# Altium schematic sheet Ringer_Sheet.SchDoc
size A4; SheetNumber: 3; SheetTotal: 6
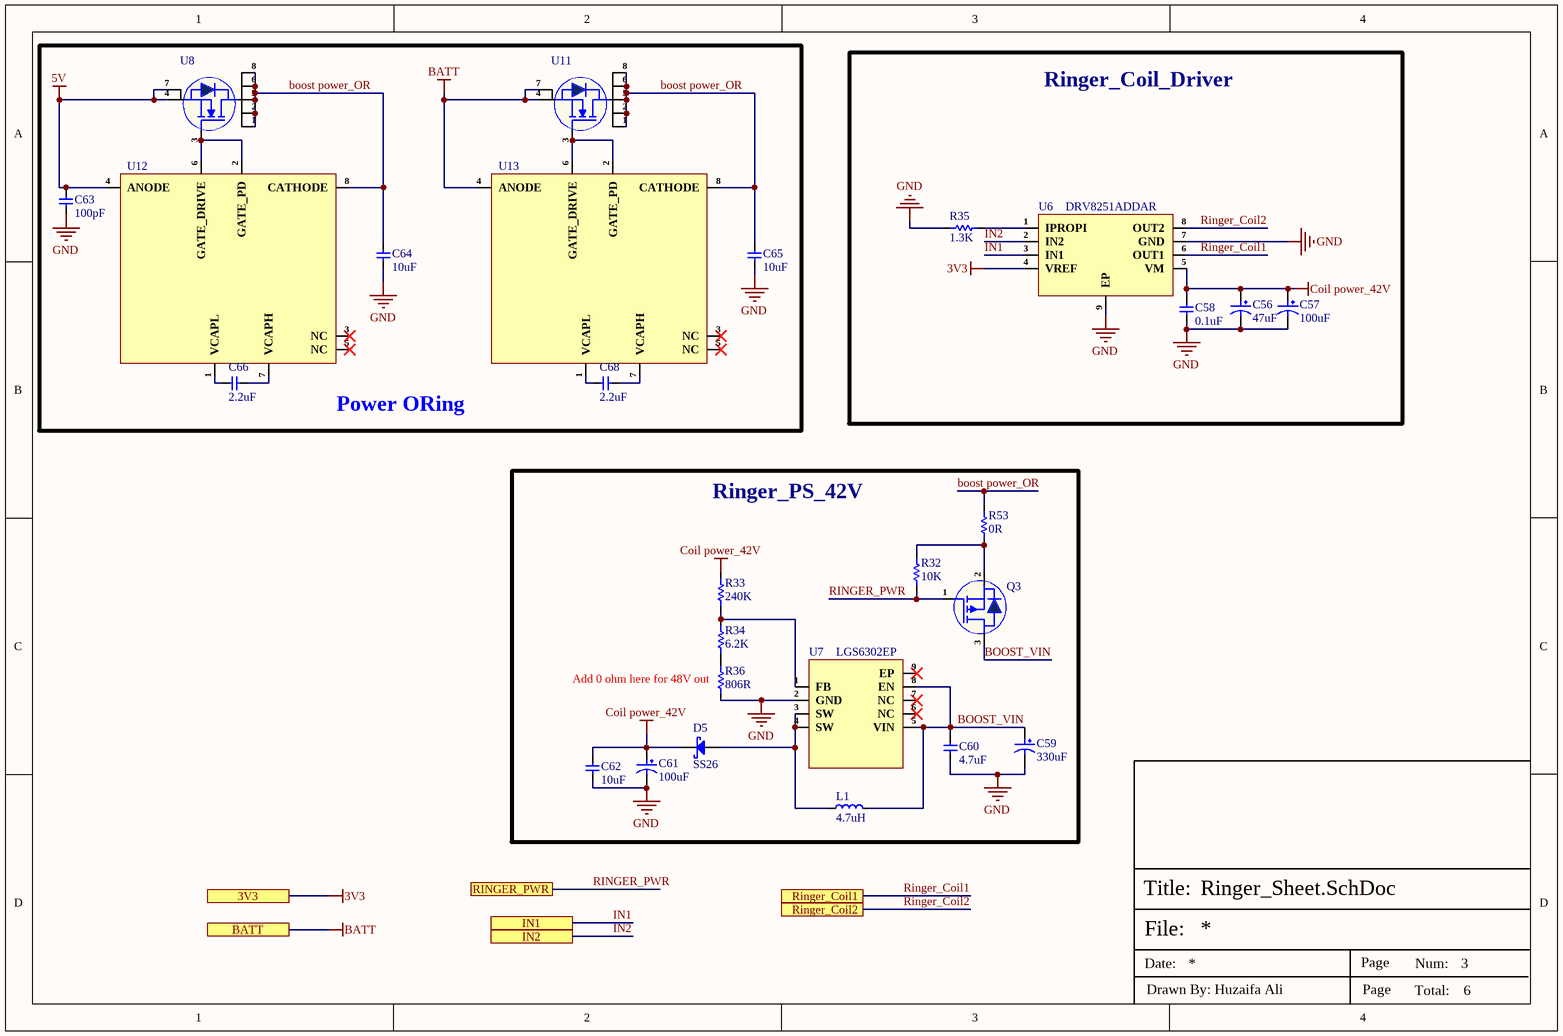
[diagram p0: Ringer_Sheet.SchDoc]

## Parts
C56  47uF  [EEEFN1K470UP]
C57  100uF  [VKMD1451K101MV]
C58  0.1uF  [Cap-0603]
C59  330uF  [GVT1C331M0607]
C60  4.7uF  [Cap-0402]
C61  100uF  [VKMD1451K101MV]
C62  10uF  [Cap-1210]
C63  100pF  [Cap-0805]
C64  10uF  [Cap-1210]
C65  10uF  [Cap-1210]
C66  2.2uF  [Cap-0805]
C68  2.2uF  [Cap-0805]
D5  SS26  [SMA(DO-214AC)]
L1  4.7uH  [YPRH0704-4R7M]
Q3  SSM3J328R,LF  [SOT-23F]  (value not drawn)
R32  10K  [Res-0402]
R33  240K  [Res-0402]
R34  6.2K  [Res-0402]
R35  1.3K  [Res-0402]
R36  806R  [Res-0402]
R53  0R  [Res-0603]
U6  DRV8251ADDAR  [SOPowerPAD(DDA)-8]
U7  LGS6302EP  [ESOP-8]
U8  CSD17313Q2  [CSD17313Q2]  (value not drawn)
U11  CSD17313Q2  [CSD17313Q2]  (value not drawn)
U12  LM74610QDGKRQ1  [8-VSSOP (5x3.1mm)]  (value not drawn)
U13  LM74610QDGKRQ1  [8-VSSOP (5x3.1mm)]  (value not drawn)

## Blocks framed on the sheet
Ringer_Coil_Driver: C56-C58 R35 U6
Ringer_PS_42V: C59-C62 D5 L1 Q3 R32-R34 R36 R53 U7

## Ports
3V3, BATT, IN1, IN2, Ringer_Coil1, Ringer_Coil2, RINGER_PWR

## Nets
3V3: U6.4(VREF) ; port 3V3
5V: C63.2 U8.4(S) U8.7(S) U12.4(ANODE)
BATT: U11.4(S) U11.7(S) U13.4(ANODE) ; port BATT
Coil power_42V: C56.1 C57.1 C58.2 C61.1 C62.2 D5.1(K) R33.2 U6.5(VM)
GND: C56.2 C57.2 C58.1 C59.2 C60.1 C61.2 C62.1 C63.1 C64.1 C65.1 R35.1 R36.1 U6.7(GND) U6.9(EP) U7.2(GND)
boost power_OR: C64.2 C65.2 R53.2 U8.1(D) U8.2(D) U8.5(D) U8.6(D) U8.8(D) U11.1(D) U11.2(D) U11.5(D) U11.6(D) U11.8(D) U12.8(CATHODE) U13.8(CATHODE)
BOOST_VIN: C59.1 C60.2 L1.2 Q3.3(D) U7.5(VIN) U7.8(EN)
IN1: U6.3(IN1) ; port IN1
IN2: U6.2(IN2) ; port IN2
Ringer_Coil1: U6.6(OUT1) ; port Ringer_Coil1
Ringer_Coil2: U6.8(OUT2) ; port Ringer_Coil2
RINGER_PWR: Q3.1(G) R32.1 ; port RINGER_PWR
NetC66_1: C66.1 U12.1(VCAPL)
NetC66_2: C66.2 U12.7(VCAPH)
NetC68_1: C68.1 U13.1(VCAPL)
NetC68_2: C68.2 U13.7(VCAPH)
NetD5_2: D5.2(A) L1.1 U7.3(SW) U7.4(SW)
NetQ3_2: Q3.2(S) R32.2 R53.1
NetR33_1: R33.1 R34.2 U7.1(FB)
NetR34_1: R34.1 R36.2
NetR35_2: R35.2 U6.1(IPROPI)
NetU8_3: U8.3(G) U12.2(GATE_PD) U12.6(GATE_DRIVE)
NetU11_3: U11.3(G) U13.2(GATE_PD) U13.6(GATE_DRIVE)

Not connected (* = marked no-connect by the designer): U7 6(NC)* 7(NC)* 9(EP)*; U12 3(NC)* 5(NC)*; U13 3(NC)* 5(NC)*

## Notes on the sheet
- Power ORing
- (near R36) Add 0 ohm here for 48V out
- File:
- Title:
- Date:
- Page
- Num:
- Total:
- Drawn By: Huzaifa Ali

## Library data of the parts
C56 = EEE-FN1K470UP: CAP ALUM 47UF 20% 80V SMD; Manufacturer: Panasonic; Item Type: Capacitors; Dissipation Factor: 8%; ESR (Equivalent Series Resistance): 1.3R; Leakage Current: 37.6uA; Life (Hours): 2000Hour; Ripple Current: 130mA; Supplier: Mouser; LCSC Part Number: C494871; Manufacturer Part Number: EEE-FN1K470UP; RoHS: No; Stock: 4971; Pricing: 1=0.81, 10=0.516, 50=0.516, 100=0.413, 1000=0.296, 10000=0.249 (USD); Case/Package: Radial; Min Operating Temperature: -55°C; Max Operating Temperature: 105°C; Value: 47uF; Tolerance: 20%; Voltage Rating: 80V; Height: 10.5mm
C57 C61 = VKMD1451K101MV: 100uF 80V 735mA@100kHz ±20% SMD,D8xL14.5mm Aluminum Electrolytic Capacitors - SMD ROHS; Manufacturer: Ymin; Manufacturer Part Number: VKMD1451K101MV; Package: SMD,D8xL14.5mm; LCSC Part Number: C487409; Item Type: Capacitor; ComponentLink1Description: LCSC; ComponentLink1URL: https://www.lcsc.com/product-detail/Aluminum-Electrolytic-Capacitors-SMD_Ymin-VKMD1451K101MV_C487409.html
C58 = CC0603ZRY5V9BB104: CAP CER 0.1UF 50V Y5V 0603; Manufacturer: Yageo; Capacitance: 100nF; Tolerance: 80%; Item Type: Capacitor; Supplier 1: Digi-Key; Manufacturer Part Number: CC0603ZRY5V9BB104; Stock 1: 15000880; Pricing 1: 1=0.1, 10=0.075, 100=0.0334, 500=0.02386, 1000=0.01874 (USD); Mount: Surface Mount; Case/Package: 0603; Number of Pins: 2; Case Code (Metric): 1608; Case Code (Imperial): 0603; Min Operating Temperature: -30°C; Max Operating Temperature: 85°C; Dielectric: Y5V; Voltage Rating: 50V; Package Quantity: 1; Packaging: Tape and Reel; Voltage Rating (DC): 50V; Termination: SMD/SMT; Composition: Ceramic; Voltage: 50V; Length: 1.6mm; Height: 0.8mm; Width: 0.031inch; Thickness: 0.035inch; Depth: 0.8mm; Radiation Hardening: No; REACH SVHC: No SVHC; Lead Free: Lead Free; Halogen Free: Halogen Free; ComponentLink1URL: http://www.yageo.com/documents/recent/UPY-GPHC_Y5V_6.3V-to-50V_8.pdf?src-supplier=Digi-Key; ComponentLink1Description: http://www.yageo.com/documents/recent/UPY-GPHC_Y5V_6.3V-to-50V_8.pdf?src-supplier=Digi-Key; ComponentLink2URL: http://www.yageo.com/documents/recent/UPY-GPHC_Y5V_6.3V-to-50V_5.pdf?src-supplier=Avnet+Europe; ComponentLink2Description: http://www.yageo.com/documents/recent/UPY-GPHC_Y5V_6.3V-to-50V_5.pdf?src-supplier=Avnet+Europe; ComponentLink3URL: https://www.verical.com/server-webapp/html/getDatasheet?partID=403611&src-supplier=Verical; ComponentLink3Description: https://www.verical.com/server-webapp/html/getDatasheet?partID=403611&src-supplier=Verical; ComponentLink4URL: http://www.mouser.com/ds/2/447/Yageo_UPY-GP_NP0_16V-to-50V_9-358835.pdf?src-supplier=Mouser; ComponentLink4Description: http://www.mouser.com/ds/2/447/Yageo_UPY-GP_NP0_16V-to-50V_9-358835.pdf?src-supplier=Mouser; ComponentLink5URL: http://www.farnell.com/datasheets/1132289.pdf?src-supplier=Element14; ComponentLink5Description: http://www.farnell.com/datasheets/1132289.pdf?src-supplier=Element14; Supplier Part Number 1: 311-1343-1-ND; LCSC Part Number: C106221
C59 = GVT1C331M0607: 330uF 16V ±20% SMD,D6.3xL7.7mm Aluminum Electrolytic Capacitors - SMD ROHS; Manufacturer: Honor Elec; Manufacturer Part Number: GVT1C331M0607; Package: SMD,D6.3xL7.7mm; LCSC Part Number: C2980164; Item Type: Capacitor; ComponentLink1Description: LCSC; ComponentLink1URL: https://www.lcsc.com/product-detail/Aluminum-Electrolytic-Capacitors-SMD_Honor-Elec-GVT1C331M0607_C2980164.html
C60 = CC0402KRX5R6BB475: CAP CER 4.7UF 10V X5R 0402; Manufacturer: Yageo; Tolerance: 10%; Supplier 1: Farnell; Manufacturer Part Number: CC0402KRX5R6BB475; RoHS: Yes; Category: Ceramic Capacitors; Stock 1: 20000; Pricing 1: 10000=0.02310, 50000=0.02100 (GBP); Mount: Surface Mount; Case/Package: 0402; Case Code (Imperial): 0402; Case Code (Metric): 1005; Min Operating Temperature: -55°C; Max Operating Temperature: 85°C; Packaging: Cut Tape; Capacitance: 4.7uF; Voltage Rating: 10V; RoHS Compliant: Yes; ComponentLink1URL: http://www.yageo.com/documents/recent/UPY-GPHC_X5R_4V-to-50V_25.pdf?src-supplier=Digi-Key; ComponentLink1Description: http://www.yageo.com/documents/recent/UPY-GPHC_X5R_4V-to-50V_25.pdf?src-supplier=Digi-Key; Supplier Part Number 1: 3871698; LCSC Part Number: C326586
C62 C64 C65 = GRM32ER71J106KA12L: CAP CER 10UF 63V X7R 1210; Manufacturer: Murata; Item Type: Capacitor; Supplier: Avnet; Supplier Part Number: GRM32ER71J106KA12L; Manufacturer Part Number: GRM32ER71J106KA12L; RoHS: Yes; Stock: 55000; Pricing: 1000=0.3451, 2000=0.33698, 4000=0.32886, 6000=0.32074, 8000=0.31262 (USD); ComponentLink1URL: http://www.mouser.com/ds/2/281/c02e-2905.pdf?src-supplier=Mouser; ComponentLink1Description: http://www.mouser.com/ds/2/281/c02e-2905.pdf?src-supplier=Mouser; ComponentLink2URL: http://www.farnell.com/datasheets/2079202.pdf?src-supplier=Farnell; ComponentLink2Description: http://www.farnell.com/datasheets/2079202.pdf?src-supplier=Farnell; ComponentLink3URL: http://search.murata.co.jp/Ceramy/image/img/A01X/G101/ENG/GRM32ER71J106KA12-01.pdf?src-supplier=Digi-Key; ComponentLink3Description: http://search.murata.co.jp/Ceramy/image/img/A01X/G101/ENG/GRM32ER71J106KA12-01.pdf?src-supplier=Digi-Key; ComponentLink4URL: https://datasheet.octopart.com/GRM32ER71J106KA12L-Murata-datasheet-22122223.pdf?src-supplier=Future+Electronics; ComponentLink4Description: https://datasheet.octopart.com/GRM32ER71J106KA12L-Murata-datasheet-22122223.pdf?src-supplier=Future+Electronics; ComponentLink5URL: http://psearch.en.murata.com/capacitor/product/GRM32ER71J106KA12%23.pdf?src-supplier=Avnet; ComponentLink5Description: http://psearch.en.murata.com/capacitor/product/GRM32ER71J106KA12%23.pdf?src-supplier=Avnet; ComponentLink6URL: http://www.farnell.com/datasheets/2079202.pdf?src-supplier=Newark; ComponentLink6Description: http://www.farnell.com/datasheets/2079202.pdf?src-supplier=Newark; ComponentLink7URL: http://www.farnell.com/datasheets/2079202.pdf?src-supplier=Element14; ComponentLink7Description: http://www.farnell.com/datasheets/2079202.pdf?src-supplier=Element14; Package: 1210; LCSC Part Number: C437568; ComponentLink8Description: LCSC; ComponentLink8URL: https://www.lcsc.com/product-detail/Multilayer-Ceramic-Capacitors-MLCC-SMD-SMT_Murata-Electronics-GRM32ER71J106KA12L_C437568.html
C63 = CC0805KRX7R9BB101: CAP CER 100PF 50V X7R 0805; Manufacturer: Yageo; Item Type: Capacitor; Supplier: Future Electronics; Supplier Part Number: 3327608; Manufacturer Part Number: CC0805KRX7R9BB101; RoHS: Yes; Category: Ceramic Capacitors; Stock: 516000; Pricing: 4000=0.0077, 16000=0.0073, 60000=0.007, 100000=0.0068, 200000=0.0065 (USD); ComponentLink1URL: https://datasheet.ciiva.com/11465/upy-gphc-x7r-6-3v-to-50v-8-11465306.pdf?src-supplier=Avnet; ComponentLink1Description: https://datasheet.ciiva.com/11465/upy-gphc-x7r-6-3v-to-50v-8-11465306.pdf?src-supplier=Avnet; LCSC Part Number: C107140
C66 C68 = C2012X5R1H225K125AB: CAP CER 2.2UF 50V X5R 0805; Manufacturer: TDK; Dielectric Material: 4241ConductorMaterial; Item Type: Capacitor; Supplier: Avnet; Supplier Part Number: C2012X5R1H225K125AB; Manufacturer Part Number: C2012X5R1H225K125AB; RoHS: Yes; Category: Ceramic Capacitors; Stock: 6000; Pricing: 2000=0.08532 (USD); Material: 4241ConductorMaterial; Lead Free: 5697LeadFree; ComponentLink1URL: https://datasheet.ciiva.com/24216/c2012x5r1h225k125ab-264892-24216756.pdf?src-supplier=Mouser; ComponentLink1Description: https://datasheet.ciiva.com/24216/c2012x5r1h225k125ab-264892-24216756.pdf?src-supplier=Mouser; ComponentLink2URL: https://datasheet.ciiva.com/6287/tdkmlcccaprange-6287487.pdf?src-supplier=Digikey; ComponentLink2Description: https://datasheet.ciiva.com/6287/tdkmlcccaprange-6287487.pdf?src-supplier=Digikey; ComponentLink3URL: https://datasheet.ciiva.com/6287/tdkmlcccaprange-6287494.pdf?src-supplier=Digikey; ComponentLink3Description: https://datasheet.ciiva.com/6287/tdkmlcccaprange-6287494.pdf?src-supplier=Digikey; ComponentLink4URL: https://datasheet.ciiva.com/6287/tdkmlcccaprange-6287500.pdf?src-supplier=Digikey; ComponentLink4Description: https://datasheet.ciiva.com/6287/tdkmlcccaprange-6287500.pdf?src-supplier=Digikey; ComponentLink5URL: https://datasheet.ciiva.com/28451/1796654-28451710.pdf?src-supplier=Element14; ComponentLink5Description: https://datasheet.ciiva.com/28451/1796654-28451710.pdf?src-supplier=Element14; ComponentLink6URL: https://datasheet.ciiva.com/22725/1913358-22725562.pdf?src-supplier=Element14; ComponentLink6Description: https://datasheet.ciiva.com/22725/1913358-22725562.pdf?src-supplier=Element14
D5 = SS26: 60V 700mV@2A 2A SMA(DO-214AC) Schottky Barrier Diodes (SBD) ROHS; Manufacturer: MDD; Item Type: Diode; Manufacturer Part Number: SS26; Package: SMA(DO-214AC); LCSC Part Number: C14238; ComponentLink1Description: LCSC; ComponentLink1URL: https://www.lcsc.com/product-detail/Schottky-Barrier-Diodes-SBD_MDD-Microdiode-Electronics-SS26_C14238.html
L1 = YPRH0704-4R7M: 3.7A 4.7uH ±20% SMD,7.3x7.3mm Power Inductors ROHS; Manufacturer: YJYCOIN; Manufacturer Part Number: YPRH0704-4R7M; Package: SMD,7.3x7.3mm; LCSC Part Number: C514806; Item Type: Inductor; ComponentLink1Description: LCSC; ComponentLink1URL: https://www.lcsc.com/product-detail/Power-Inductors_YJYCOIN-YPRH0704-4R7M_C514806.html
Q3 = SSM3J328R,LF: MOSFET P-CH 20V 6A SOT23F; Manufacturer: Toshiba; Item Type: MOSFETs; Rds On Max: 29.8mR; Input Capacitance: 840pF; Max Power Dissipation: 1W; Gate to Source Voltage (Vgs): 8V; Turn-Off Delay Time: 107ns; Turn-On Delay Time: 32ns; Number of Channels: 1; Drain to Source Resistance: 47.4mR; Polarity: P-CHANNEL; Supplier: Digikey; LCSC Part Number: C396016; Manufacturer Part Number: SSM3J328R,LF; RoHS: Yes; Stock: 582786; Pricing: 1=0.41, 10=0.252, 100=0.1588, 500=0.11846, 1000=0.10542 (USD); Mounting Technology: Surface Mount; Case/Package: SOT-23-3; Min Operating Temperature: -55°C; Max Operating Temperature: 150°C; Continuous Drain Current (ID): 6A; Package Quantity: 3000; Packaging: Tape and Reel; Drain to Source Voltage (Vdss): 20V; Radiation Hardening: No; RoHS Compliant: Yes; ComponentLink1URL: https://datasheet.ciiva.com/11158/ssm3j328r-datasheet-en-20140301-11158652.pdf?src-supplier=Avnet; ComponentLink1Description: https://datasheet.ciiva.com/11158/ssm3j328r-datasheet-en-20140301-11158652.pdf?src-supplier=Avnet; ComponentLink2URL: https://datasheet.ciiva.com/24106/ssm3j328r-datasheet-en-20140301-24106699.pdf?src-supplier=Mouser; ComponentLink2Description: https://datasheet.ciiva.com/24106/ssm3j328r-datasheet-en-20140301-24106699.pdf?src-supplier=Mouser; ComponentLink3URL: https://datasheet.ciiva.com/45425/ssm3j328r-datasheet-en-20140301-45425519.pdf?src-supplier=Digikey; ComponentLink3Description: https://datasheet.ciiva.com/45425/ssm3j328r-datasheet-en-20140301-45425519.pdf?src-supplier=Digikey; ComponentLink4URL: https://datasheet.ciiva.com/45425/ssm3j328r-datasheet-en-20140301-45425813.pdf?src-supplier=Digikey; ComponentLink4Description: https://datasheet.ciiva.com/45425/ssm3j328r-datasheet-en-20140301-45425813.pdf?src-supplier=Digikey
R32 = RC0402FR-0710KL: RES 10K OHM 1% 1/16W 0402; Manufacturer: Yageo; Resistance: 10kR; Voltage Rating (DC): 50V; Temperature Coefficient: 100ppm/°C; Power Rating: 62.5mW; Max Power Dissipation: 63mW; Item Type: Resistor; Supplier 1: Mouser; Manufacturer Part Number: RC0402FR-0710KL; RoHS: Yes; Category: Chip SMD Resistors; Stock 1: 18648329; Pricing 1: 1=0.10000, 10=0.01400, 50=0.01400, 100=0.00500, 1000=0.00300, 10000=0.00200 (USD); Case/Package: 0402; Number of Pins: 2; Case Code (Imperial): 0402; Case Code (Metric): 1005; Min Operating Temperature: -55°C; Max Operating Temperature: 155°C; Resistor Type: Thick Film; Tolerance: 1%; Packaging: Tape and Reel; Voltage Rating: 50V; Termination: SMD/SMT; Working Voltage: 50V; Number of Terminations: 2; Features: Moisture Resistant; Series: RC; Resistance Tolerance: 1%; Construction: Rectangular; Length: 1mm; Width: 0.5mm; Height: 0.32mm; Depth: 0.5mm; Lead Pitch: 0.2mm; REACH SVHC: No SVHC; Lead Free: Lead Free; RoHS Compliant: Yes; Military Standard: Not; ComponentLink1URL: https://datasheet.ciiva.com/7660/38568-7660787.pdf?src-supplier=Element14; ComponentLink1Description: https://datasheet.ciiva.com/7660/38568-7660787.pdf?src-supplier=Element14; ComponentLink2URL: https://datasheet.ciiva.com/7849/1686128-7849814.pdf?src-supplier=Element14; ComponentLink2Description: https://datasheet.ciiva.com/7849/1686128-7849814.pdf?src-supplier=Element14; ComponentLink3URL: https://datasheet.ciiva.com/7983/1018594-7983486.pdf?src-supplier=Element14; ComponentLink3Description: https://datasheet.ciiva.com/7983/1018594-7983486.pdf?src-supplier=Element14; ComponentLink4URL: https://datasheet.ciiva.com/22747/1018594-22747512.pdf?src-supplier=Element14; ComponentLink4Description: https://datasheet.ciiva.com/22747/1018594-22747512.pdf?src-supplier=Element14; ComponentLink5URL: https://datasheet.ciiva.com/12667/pyu-rc0402-51-rohs-l-6-r-12667067.pdf?src-supplier=Mouser; ComponentLink5Description: https://datasheet.ciiva.com/12667/pyu-rc0402-51-rohs-l-6-r-12667067.pdf?src-supplier=Mouser; ComponentLink6URL: https://datasheet.ciiva.com/7849/1784430-7849813.pdf?src-supplier=Element14; ComponentLink6Description: https://datasheet.ciiva.com/7849/1784430-7849813.pdf?src-supplier=Element14; ComponentLink7URL: https://datasheet.ciiva.com/7849/1784430-7849815.pdf?src-supplier=Element14; ComponentLink7Description: https://datasheet.ciiva.com/7849/1784430-7849815.pdf?src-supplier=Element14; Supplier Part Number 1: 603-RC0402FR-0710KL; LCSC Part Number: C60490
R33 = ERJ-2RKF2403X: RES SMD 240K OHM 1% 1/10W 0402; Manufacturer: Panasonic; Item Type: Resistors; Voltage Rating (DC): 50V; Supplier: Mouser; LCSC Part Number: C413113; Manufacturer Part Number: ERJ-2RKF2403X; RoHS: Yes; Stock: 35994; Pricing: 1=0.1, 10=0.015, 50=0.015, 100=0.009, 1000=0.008, 10000=0.004 (USD); ComponentLink1URL: https://datasheet.ciiva.com/11821/0900766b80f80784-11821249.pdf?src-supplier=Rs; ComponentLink1Description: https://datasheet.ciiva.com/11821/0900766b80f80784-11821249.pdf?src-supplier=Rs; ComponentLink2URL: https://datasheet.ciiva.com/9119/aoa0000ce2-9119256.pdf?src-supplier=Avnet; ComponentLink2Description: https://datasheet.ciiva.com/9119/aoa0000ce2-9119256.pdf?src-supplier=Avnet; ComponentLink3URL: https://datasheet.ciiva.com/9119/aoa0000ce2-9119253.pdf?src-supplier=Avnet; ComponentLink3Description: https://datasheet.ciiva.com/9119/aoa0000ce2-9119253.pdf?src-supplier=Avnet
R34 = RC0402FR-076K2L: RES 6.2K OHM 1% 1/16W 0402; Manufacturer: Yageo; Item Type: Resistors; Voltage Rating: 50V; Power Rating: 63mW; Value: 6.2kR; Temperature Coefficient: 100ppm/°C; Supplier: Rs; LCSC Part Number: C137946; Manufacturer Part Number: RC0402FR-076K2L; RoHS: Yes; Stock: 13400; Pricing: 100=0.034, 1000=0.032, 2500=0.031, 5000=0.028, 10000=0.026 (DKK); Case/Package: 0402; Case Code (Imperial): 0402; Case Code (Metric): 1005; Min Operating Temperature: -55°C; Max Operating Temperature: 155°C; Tolerance: 1%; Packaging: Tape and Reel; Package Quantity: 1; Termination: SMD/SMT; Resistor Type: Thick Film; Number of Terminations: 2; Max Power Dissipation: 63mW; Voltage Rating (DC): 50V; Features: Moisture Resistant; Series: RC; Construction: Rectangular; Resistance Tolerance: 1%; Length: 1mm; Width: 0.02inch; Height: 0.016inch; Depth: 0.5mm; Military Standard: Not; Lead Free: Lead Free; RoHS Compliant: Yes; Reach SVHC Compliant: Unknown; ComponentLink1URL: https://datasheet.ciiva.com/7850/1018594-7850076.pdf?src-supplier=Element14; ComponentLink1Description: https://datasheet.ciiva.com/7850/1018594-7850076.pdf?src-supplier=Element14; ComponentLink2URL: https://datasheet.ciiva.com/7850/1018594-7850077.pdf?src-supplier=Element14; ComponentLink2Description: https://datasheet.ciiva.com/7850/1018594-7850077.pdf?src-supplier=Element14
R35 = ERJ-2GEJ132X: RES SMD 1.3K OHM 5% 1/10W 0402
R36 = 0402WGD8060TCE: 62.5mW Thick Film Resistors 50V ±100ppm/℃ ±0.5% 806Ω 0402 Chip Resistor - Surface Mount ROHS; Manufacturer: UNI-ROYAL; Manufacturer Part Number: 0402WGD8060TCE; Package: 0402; LCSC Part Number: C423268; Item Type: Resistor; ComponentLink1Description: LCSC; ComponentLink1URL: https://www.lcsc.com/product-detail/Chip-Resistor-Surface-Mount_UNI-ROYAL-Uniroyal-Elec-0402WGD8060TCE_C423268.html
R53 = RC0603JR-070RL: RES 0 OHM JUMPER 1/10W 0603; Manufacturer: Yageo; Resistance: 0mR; Tolerance: 1%; Power Rating: 100mW; Voltage Rating (DC): 50V; Temperature Coefficient: 200ppm/°C; Resistance Tolerance: 5%; Item Type: Resistor; Supplier 1: Digi-Key; Manufacturer Part Number: RC0603JR-070RL; RoHS: Yes; Category: Chip SMD Resistors; Stock 1: 18081776; Pricing 1: 1=0.10000, 10=0.01700, 25=0.01240, 50=0.00960, 100=0.00700, 250=0.00536, 500=0.00430, 1000=0.00316 (USD); Case/Package: 0603; Number of Pins: 2; Contact Plating: Tin,Matte; Case Code (Imperial): 0603; Case Code (Metric): 1608; Size Code: 0603; Min Operating Temperature: -55°C; Max Operating Temperature: 155°C; Resistor Type: Thick Film; Packaging: Tape and Reel; Termination: SMD/SMT; Series: RC; Technology: THICK FILM; Package Quantity: 5000; Voltage Rating: 50V; Features: Moisture Resistant; Max Power Dissipation: 100mW; Number of Terminations: 2; Construction: Rectangular; Length: 1.6mm; Width: 0.8mm; Height: 0.45mm; Depth: 0.8mm; Radiation Hardening: No; Reach SVHC Compliant: No SVHC; Lead Free: Lead Free; RoHS Compliant: Yes; Military Standard: Not; Supplier Part Number 1: 311-0.0GRCT-ND; LCSC Part Number: C95177
U6 = DRV8251ADDAR: 48-V, 3.5-A H BRIDGE MOTOR DRIVE; Manufacturer: Texas Instruments; Item Type: IC; Supplier: Digikey; LCSC Part Number: C5218844; Manufacturer Part Number: DRV8251ADDAR; RoHS: No; Pricing: 1=1.78, 10=1.309, 25=1.1904, 100=1.0602, 250=0.99812, 500=0.96074, 1000=0.92996 (USD); Pins: 8NUMBER; Length: 4.89mm; Width: 3.9mm; Height: 1.7mm; Thickness: 1.48mm
U7 = LGS6302EP: Boost type Adjustable 500mA 3V~60V 3V~60V ESOP-8 DC-DC Converters ROHS; Manufacturer: Legend-Si; Item Type: IC; Manufacturer Part Number: LGS6302EP; Package: ESOP-8; LCSC Part Number: C5280693; ComponentLink1Description: LCSC; ComponentLink1URL: https://www.lcsc.com/product-detail/DC-DC-Converters_Legend-Si-LGS6302EP_C5280693.html
U8 U11 = CSD17313Q2: 30V 5A 2.3W 30mΩ@4A,8V null WSON-6 MOSFETs ROHS; Manufacturer: Texas Instruments; Item Type: IC; Supplier: Mouser; Supplier Part Number: 595-CSD17313Q2; Manufacturer Part Number: CSD17313Q2; RoHS: Yes; Category: MOSFETs; Stock: 12528; Pricing: 1=0.59, 10=0.502, 50=0.502, 100=0.375, 1000=0.228, 10000=0.156 (USD); ComponentLink1URL: https://datasheet.ciiva.com/6388/csd17313q2-6388183.pdf?src-supplier=Digi-Key; ComponentLink1Description: https://datasheet.ciiva.com/6388/csd17313q2-6388183.pdf?src-supplier=Digi-Key; ComponentLink2URL: https://datasheet.ciiva.com/4438/slps260b-128048-4438543.pdf?src-supplier=Mouser; ComponentLink2Description: https://datasheet.ciiva.com/4438/slps260b-128048-4438543.pdf?src-supplier=Mouser; ComponentLink3URL: https://datasheet.ciiva.com/1255/csd17313q2-1255358.pdf?src-supplier=Newark; ComponentLink3Description: https://datasheet.ciiva.com/1255/csd17313q2-1255358.pdf?src-supplier=Newark; ComponentLink4URL: https://datasheet.ciiva.com/7968/1536237-7968249.pdf?src-supplier=Element14; ComponentLink4Description: https://datasheet.ciiva.com/7968/1536237-7968249.pdf?src-supplier=Element14; LCSC Part Number: C2863837
U12 U13 = LM74610QDGKRQ1: IC SMART DIODE CTLR 8VSSOP; Manufacturer: Texas Instruments; Quiescent Current: 0pA; Operating Supply Current: 0A; Supplier: Mouser; Supplier Part Number: 595-LM74610QDGKRQ1; Manufacturer Part Number: LM74610QDGKRQ1; RoHS: Yes; Category: Power Management ICs; Stock: 4920; Pricing: 1=2.47, 10=2.1, 50=2.1, 100=1.79, 1000=1.2, 10000=1.08 (USD); Mounting Technology: Surface Mount; Case/Package: VSSOP; Pins: 8; Weight: 0.005997oz; Min Operating Temperature: -40°C; Max Operating Temperature: 125°C; Packaging: Cut Tape; Series: Automotive, AEC-Q100; Package Quantity: 2500; Lead Free: Lead Free; RoHS Compliant: Yes; ComponentLink1URL: http://www.ti.com/lit/ds/symlink/lm74610-q1.pdf?src-supplier=Digikey; ComponentLink1Description: http://www.ti.com/lit/ds/symlink/lm74610-q1.pdf?src-supplier=Digikey; Item Type: IC